# Altium schematic sheet Inverter_540VDC_V2.SchDoc
size A0; SheetNumber: 1; SheetTotal: 1; SPICEModelCacheYQEDCYZF: <root> / <DocumentId>YQEDCYZF</DocumentId> / </root>
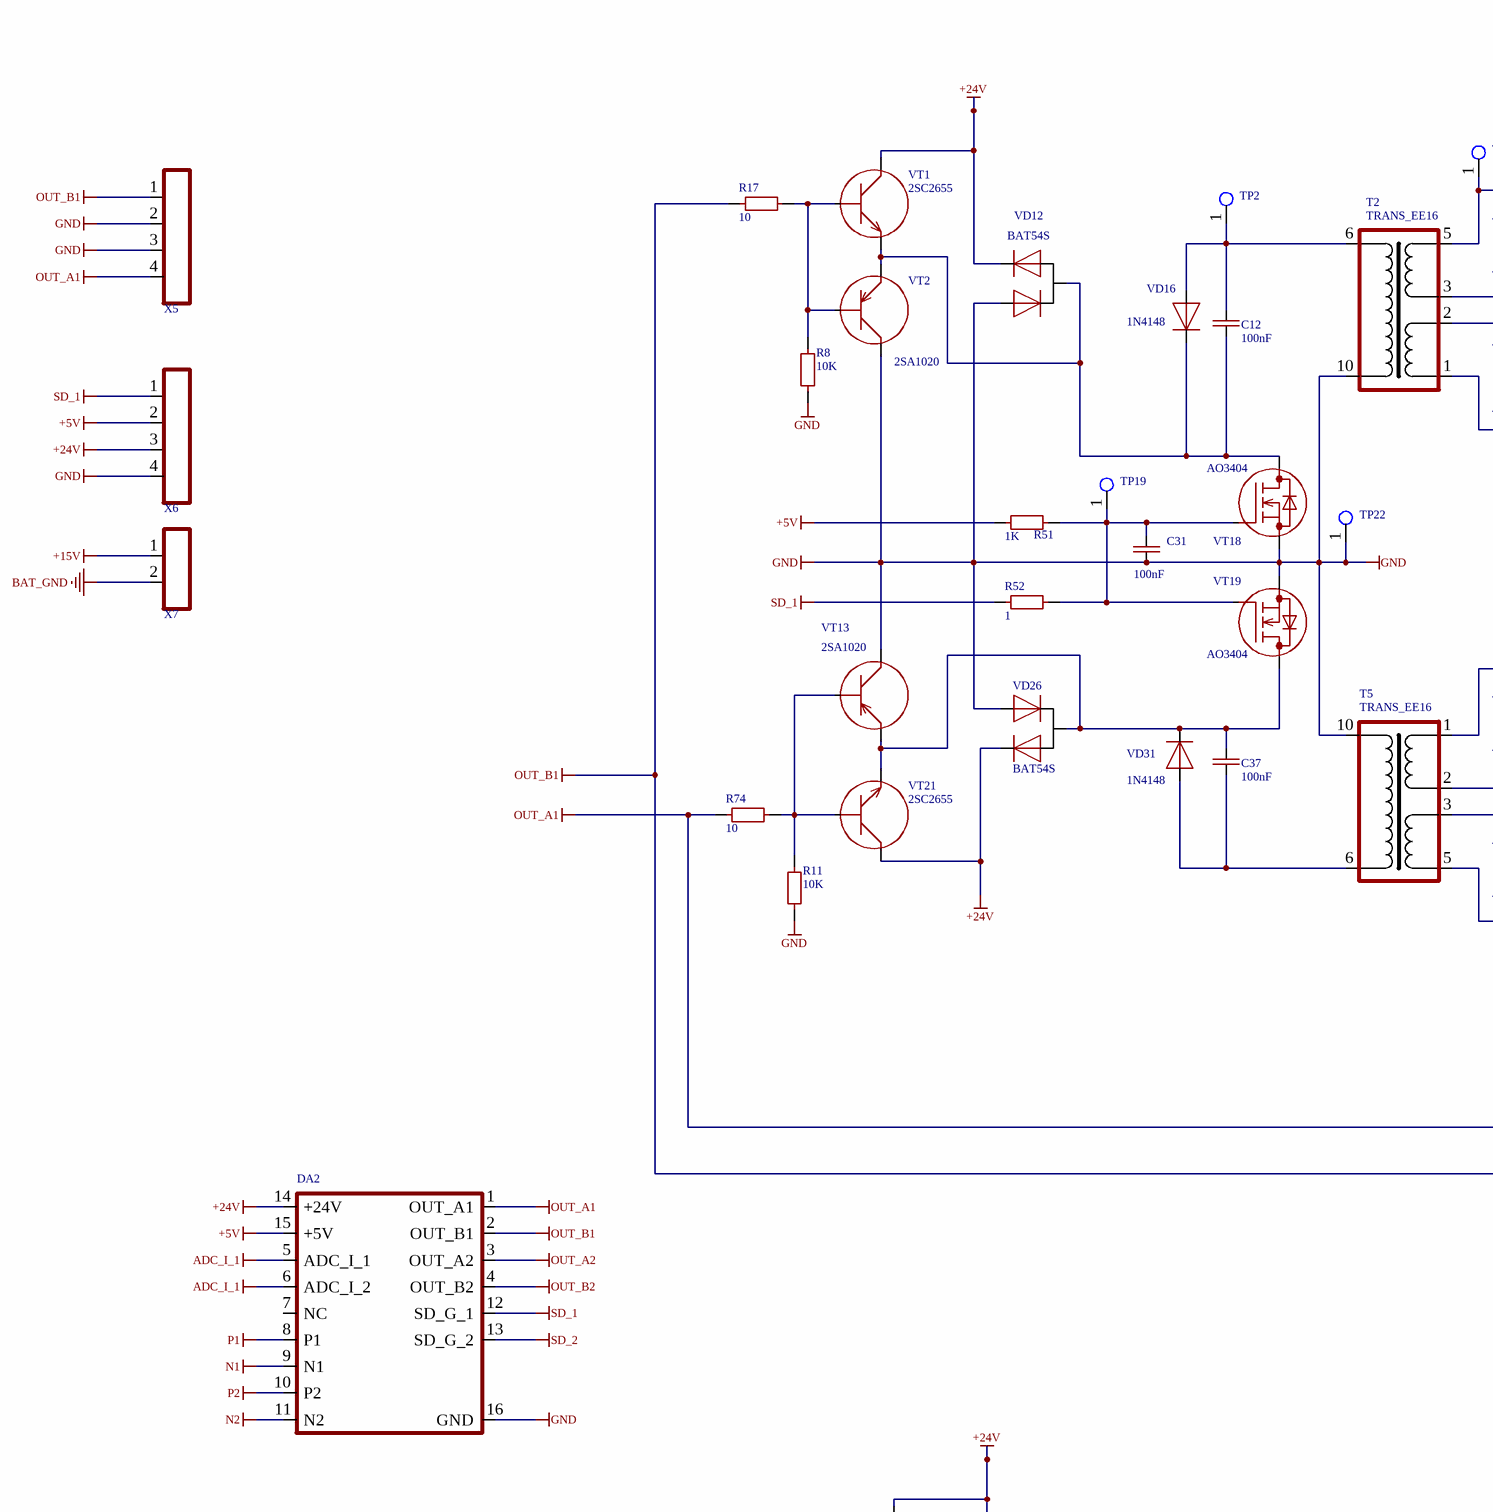
[diagram p0: Inverter_540VDC_V2.SchDoc, top left]
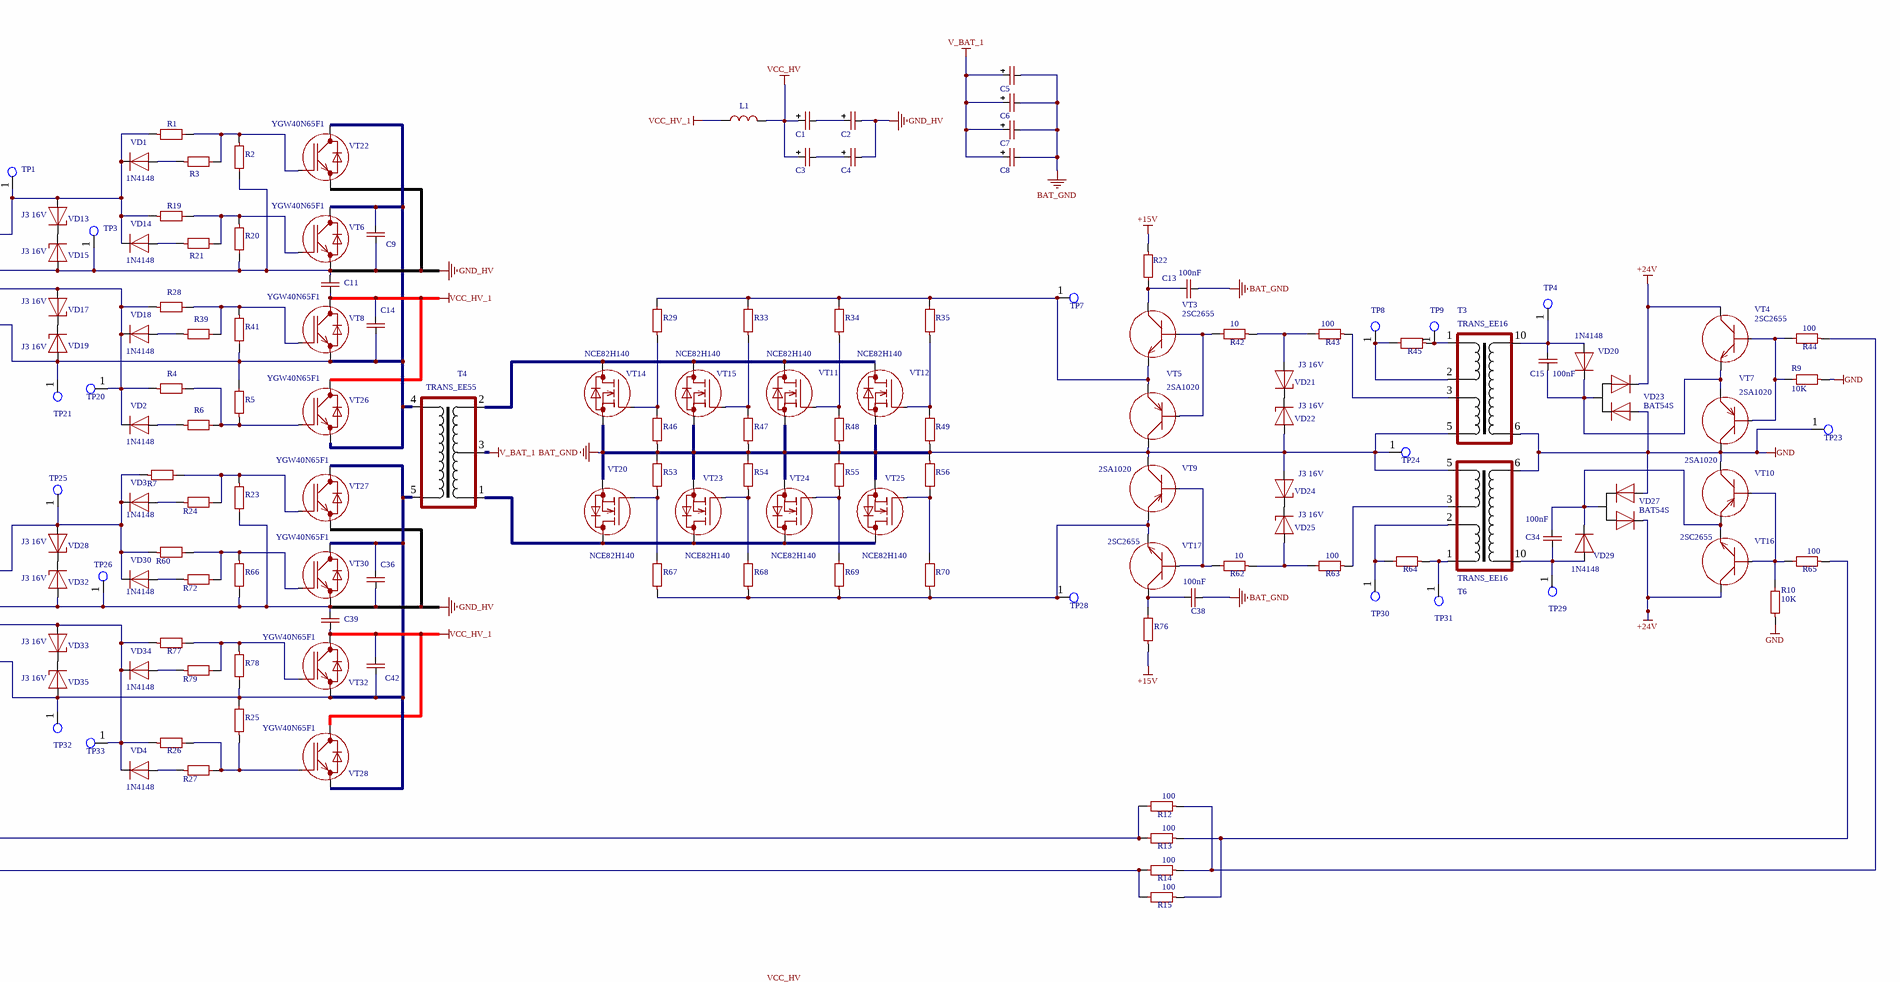
[diagram p1: Inverter_540VDC_V2.SchDoc, top right]
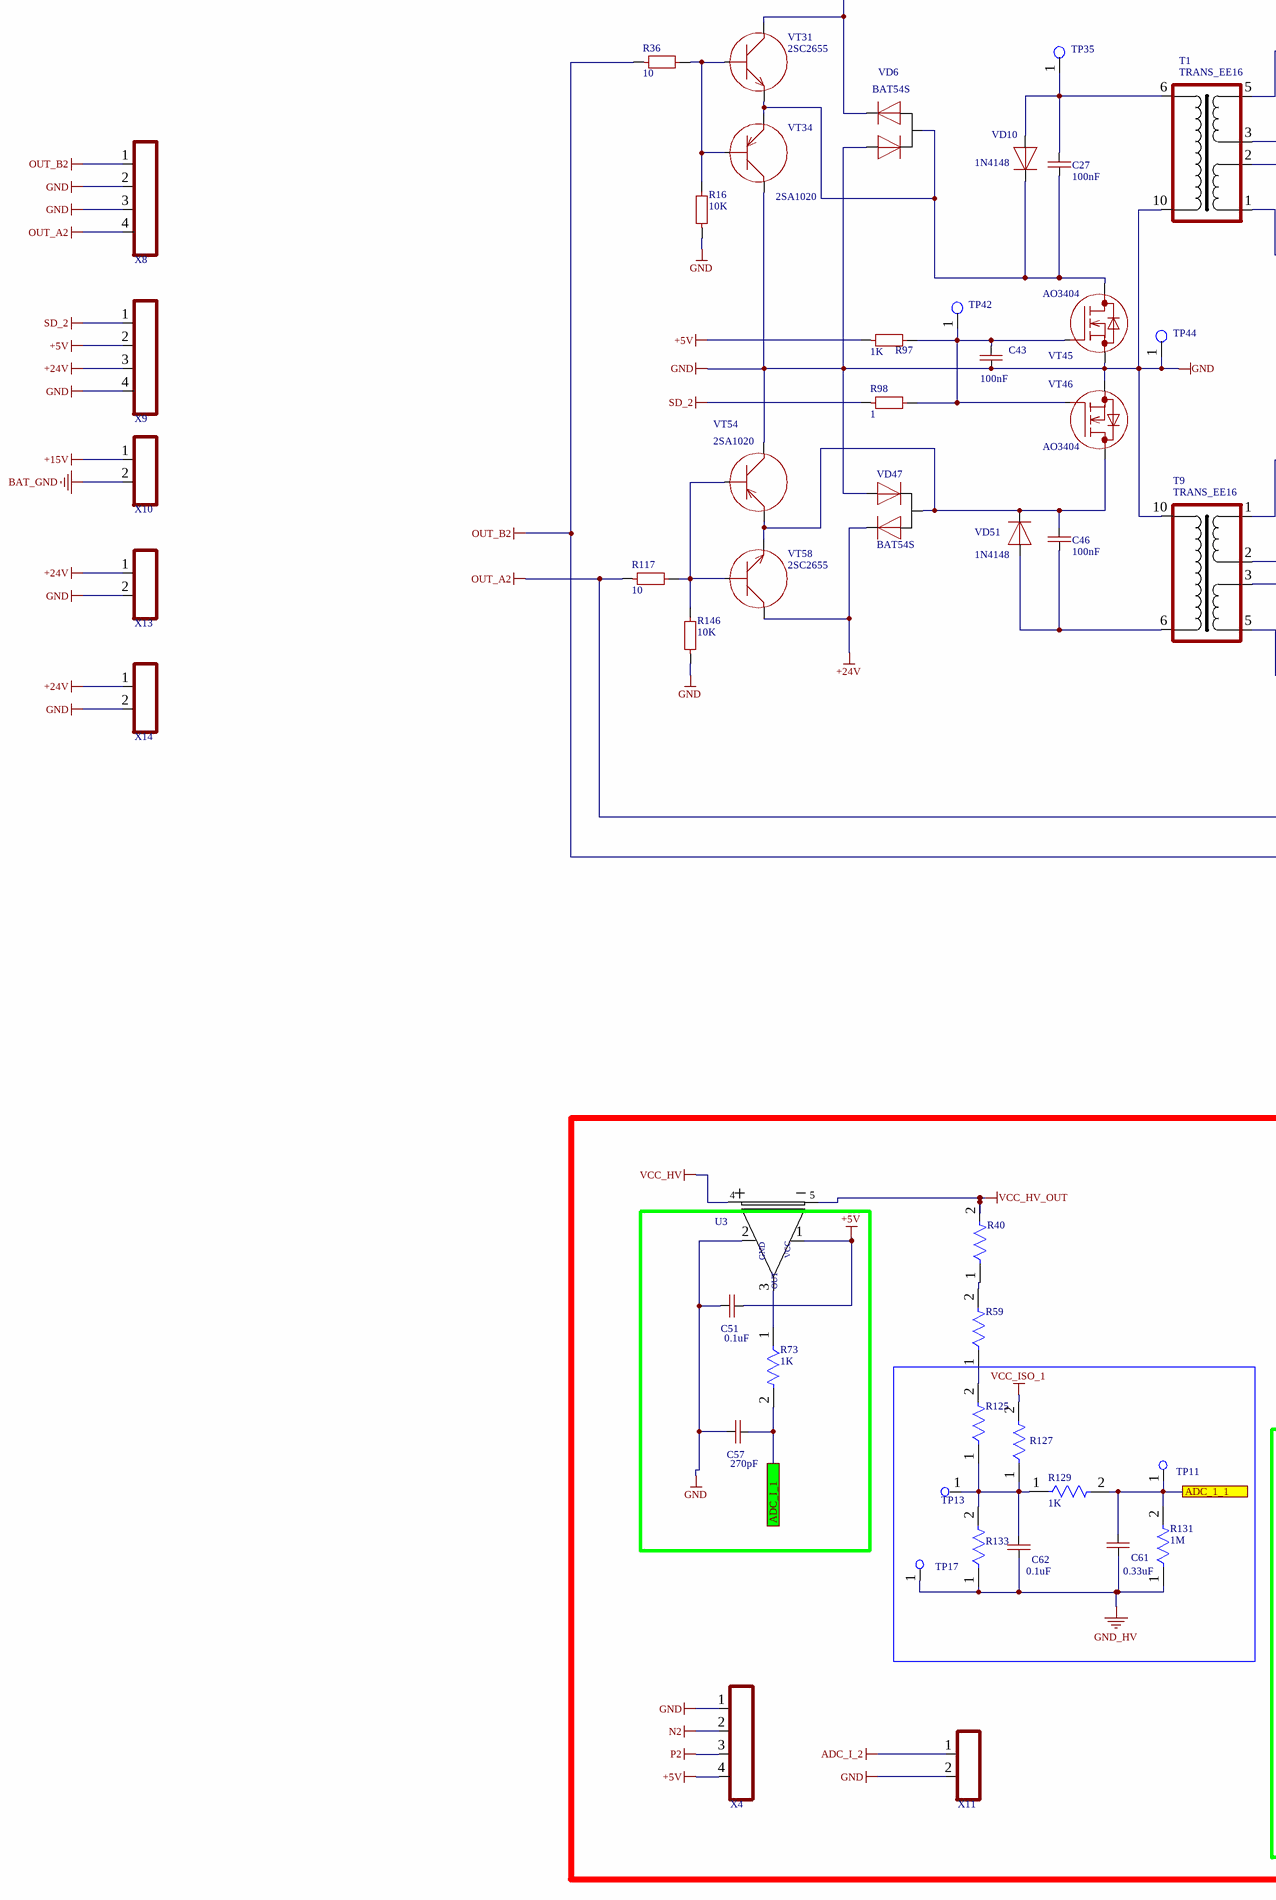
[diagram p2: Inverter_540VDC_V2.SchDoc, bottom left]
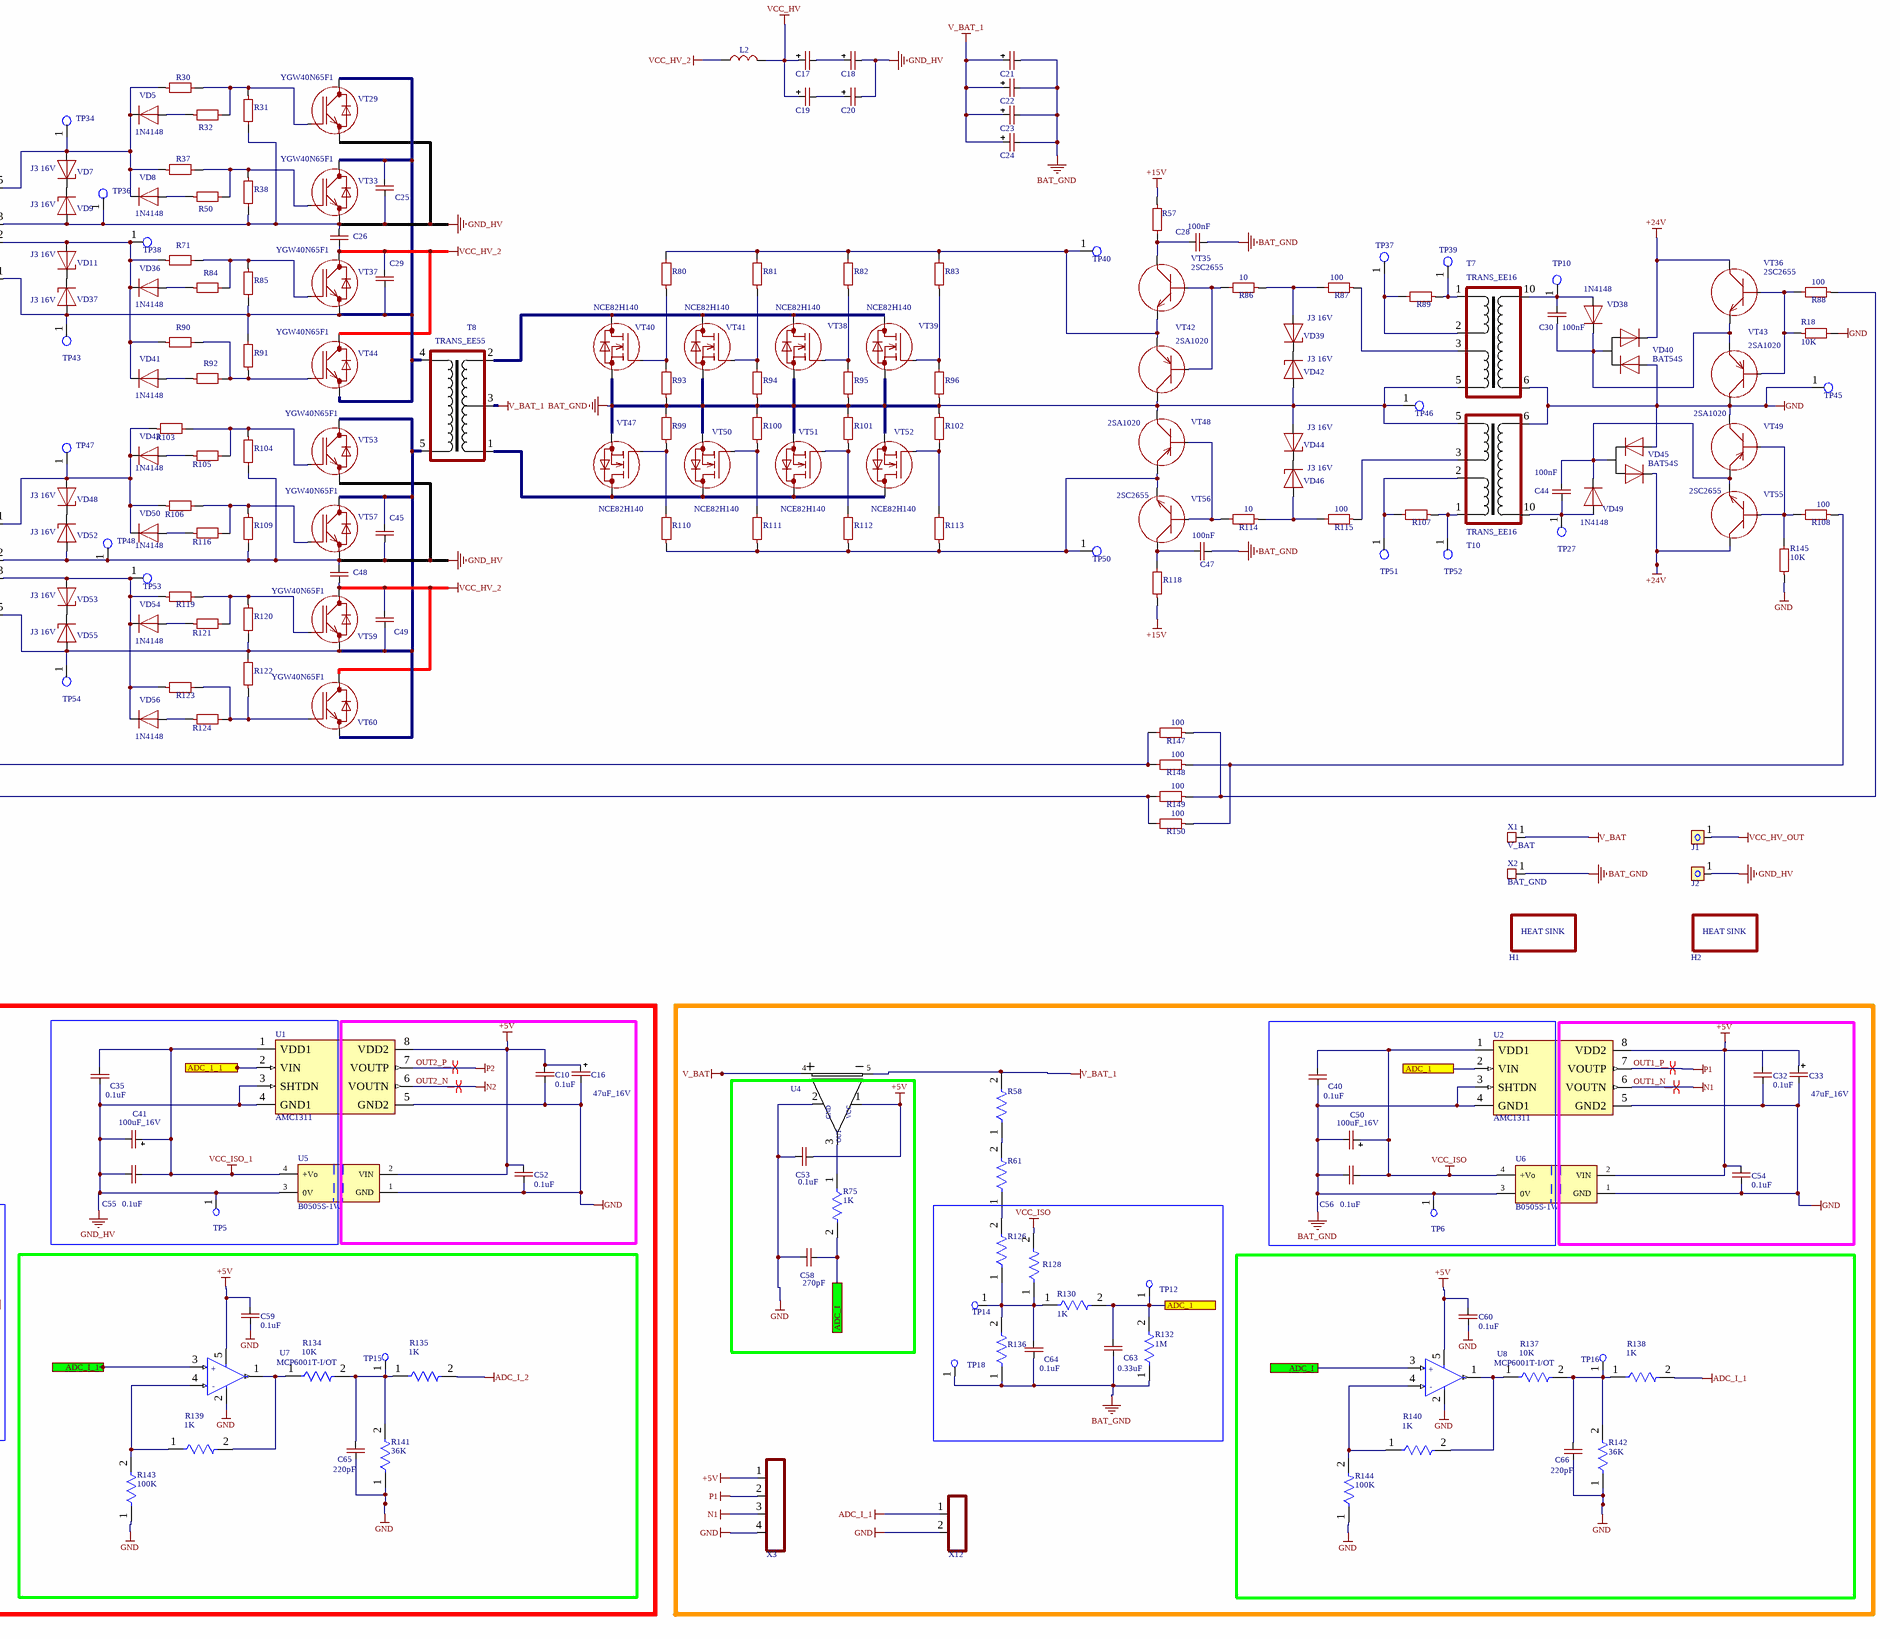
[diagram p3: Inverter_540VDC_V2.SchDoc, bottom right]

## Parts
C1  CAP-POLAR  [CAPPOL-65x35]  (value not drawn)
C2  CAP-POLAR  [CAPPOL-65x35]  (value not drawn)
C3  CAP-POLAR  [CAPPOL-65x35]  (value not drawn)
C4  CAP-POLAR  [CAPPOL-65x35]  (value not drawn)
C5  CAP-POLAR  [CAPPOL-100x35]  (value not drawn)
C6  CAP-POLAR  [CAPPOL-100x35]  (value not drawn)
C7  CAP-POLAR  [CAPPOL-100x35]  (value not drawn)
C8  CAP-POLAR  [CAPPOL-100x35]  (value not drawn)
C9  CAP-NON-POLAR  [CAP-FILM-22.5X26.5X10]  (value not drawn)
C10  0.1uF  [CAP-0805]
C11  CAP-NON-POLAR  [CAP-FILM-22.5X26.5X10]  (value not drawn)
C12  100nF  [CAP-1206]
C13  100nF  [CAP-0805]
C14  CAP-NON-POLAR  [CAP-FILM-22.5X26.5X10]  (value not drawn)
C15  100nF  [CAP-1206]
C16  47uF_16V  [CAP-TAN-D]
C17  CAP-POLAR  [CAPPOL-65x35]  (value not drawn)
C18  CAP-POLAR  [CAPPOL-65x35]  (value not drawn)
C19  CAP-POLAR  [CAPPOL-65x35]  (value not drawn)
C20  CAP-POLAR  [CAPPOL-65x35]  (value not drawn)
C21  CAP-POLAR  [CAPPOL-100x35]  (value not drawn)
C22  CAP-POLAR  [CAPPOL-100x35]  (value not drawn)
C23  CAP-POLAR  [CAPPOL-100x35]  (value not drawn)
C24  CAP-POLAR  [CAPPOL-100x35]  (value not drawn)
C25  CAP-NON-POLAR  [CAP-FILM-22.5X26.5X10]  (value not drawn)
C26  CAP-NON-POLAR  [CAP-FILM-22.5X26.5X10]  (value not drawn)
C27  100nF  [CAP-1206]
C28  100nF  [CAP-0805]
C29  CAP-NON-POLAR  [CAP-FILM-22.5X26.5X10]  (value not drawn)
C30  100nF  [CAP-1206]
C31  100nF  [CAP-1206]
C32  0.1uF  [CAP-0805]
C33  47uF_16V  [CAP-TAN-D]
C34  100nF  [CAP-1206]
C35  0.1uF  [CAP-0805]
C36  CAP-NON-POLAR  [CAP-FILM-22.5X26.5X10]  (value not drawn)
C37  100nF  [CAP-1206]
C38  100nF  [CAP-0805]
C39  CAP-NON-POLAR  [CAP-FILM-22.5X26.5X10]  (value not drawn)
C40  0.1uF  [CAP-0805]
C41  100uF_16V  [CAP-TAN-D]
C42  CAP-NON-POLAR  [CAP-FILM-22.5X26.5X10]  (value not drawn)
C43  100nF  [CAP-1206]
C44  100nF  [CAP-1206]
C45  CAP-NON-POLAR  [CAP-FILM-22.5X26.5X10]  (value not drawn)
C46  100nF  [CAP-1206]
C47  100nF  [CAP-0805]
C48  CAP-NON-POLAR  [CAP-FILM-22.5X26.5X10]  (value not drawn)
C49  CAP-NON-POLAR  [CAP-FILM-22.5X26.5X10]  (value not drawn)
C50  100uF_16V  [CAP-TAN-D]
C51  0.1uF  [CAP-0805]
C52  0.1uF  [CAP-0805]
C53  0.1uF  [CAP-0805]
C54  0.1uF  [CAP-0805]
C55  0.1uF  [CAP-0805]
C56  0.1uF  [CAP-0805]
C57  270pF  [CAP-0805]
C58  270pF  [CAP-0805]
C59  0.1uF  [CAP-0805]
C60  0.1uF  [CAP-0805]
C61  0.33uF  [CAP-0805]
C62  0.1uF  [CAP-0805]
C63  0.33uF  [CAP-0805]
C64  0.1uF  [CAP-1206]
C65  220pF  [CAP-0805]
C66  220pF  [CAP-0805]
DA2  PWM_X2_SG3525  [PWM_X2_SG3525]  (value not drawn)
H1  HEAT SINK  [HEAT SINK]  (value not drawn)
H2  HEAT SINK  [HEAT SINK]  (value not drawn)
J1  MG_136_HT  [Conn_MEIGAN_MG136HT]  (value not drawn)
J2  MG_136_HT  [Conn_MEIGAN_MG136HT]  (value not drawn)
L1  IND-CONST  [DROSSEL_TOR_50X30X20]  (value not drawn)
L2  IND-CONST  [DROSSEL_TOR_50X30X20]  (value not drawn)
R1  RES-CONST  [RES-0805]  (value not drawn)
R2  RES-CONST  [RES-0805]  (value not drawn)
R3  RES-CONST  [RES-0805]  (value not drawn)
R4  RES-CONST  [RES-0805]  (value not drawn)
R5  RES-CONST  [RES-0805]  (value not drawn)
R6  RES-CONST  [RES-0805]  (value not drawn)
R7  RES-CONST  [RES-0805]  (value not drawn)
R8  10K  [RES-0805]
R9  10K  [RES-0805]
R10  10K  [RES-0805]
R11  10K  [RES-0805]
R12  100  [RES-0805]
R13  100  [RES-0805]
R14  100  [RES-0805]
R15  100  [RES-0805]
R16  10K  [RES-0805]
R17  10  [RES-0805]
R18  10K  [RES-0805]
R19  RES-CONST  [RES-0805]  (value not drawn)
R20  RES-CONST  [RES-0805]  (value not drawn)
R21  RES-CONST  [RES-0805]  (value not drawn)
R22  RES-CONST  [RES-2512]  (value not drawn)
R23  RES-CONST  [RES-0805]  (value not drawn)
R24  RES-CONST  [RES-0805]  (value not drawn)
R25  RES-CONST  [RES-0805]  (value not drawn)
R26  RES-CONST  [RES-0805]  (value not drawn)
R27  RES-CONST  [RES-0805]  (value not drawn)
R28  RES-CONST  [RES-0805]  (value not drawn)
R29  RES-CONST  [RES-0805]  (value not drawn)
R30  RES-CONST  [RES-0805]  (value not drawn)
R31  RES-CONST  [RES-0805]  (value not drawn)
R32  RES-CONST  [RES-0805]  (value not drawn)
R33  RES-CONST  [RES-0805]  (value not drawn)
R34  RES-CONST  [RES-0805]  (value not drawn)
R35  RES-CONST  [RES-0805]  (value not drawn)
R36  10  [RES-0805]
R37  RES-CONST  [RES-0805]  (value not drawn)
R38  RES-CONST  [RES-0805]  (value not drawn)
R39  RES-CONST  [RES-0805]  (value not drawn)
R40  (no value)  [RES-1206]
R41  RES-CONST  [RES-0805]  (value not drawn)
R42  10  [RES-0805]
R43  100  [RES-0805]
R44  100  [RES-0805]
R45  RES-CONST  [RES-2512]  (value not drawn)
R46  RES-CONST  [RES-0805]  (value not drawn)
R47  RES-CONST  [RES-0805]  (value not drawn)
R48  RES-CONST  [RES-0805]  (value not drawn)
R49  RES-CONST  [RES-0805]  (value not drawn)
R50  RES-CONST  [RES-0805]  (value not drawn)
R51  1K  [RES-0805]
R52  1  [RES-0805]
R53  RES-CONST  [RES-0805]  (value not drawn)
R54  RES-CONST  [RES-0805]  (value not drawn)
R55  RES-CONST  [RES-0805]  (value not drawn)
R56  RES-CONST  [RES-0805]  (value not drawn)
R57  RES-CONST  [RES-2512]  (value not drawn)
R58  (no value)  [RES-1206]
R59  (no value)  [RES-1206]
R60  RES-CONST  [RES-0805]  (value not drawn)
R61  (no value)  [RES-1206]
R62  10  [RES-0805]
R63  100  [RES-0805]
R64  RES-CONST  [RES-2512]  (value not drawn)
R65  100  [RES-0805]
R66  RES-CONST  [RES-0805]  (value not drawn)
R67  RES-CONST  [RES-0805]  (value not drawn)
R68  RES-CONST  [RES-0805]  (value not drawn)
R69  RES-CONST  [RES-0805]  (value not drawn)
R70  RES-CONST  [RES-0805]  (value not drawn)
R71  RES-CONST  [RES-0805]  (value not drawn)
R72  RES-CONST  [RES-0805]  (value not drawn)
R73  1K  [RES-0805]
R74  10  [RES-0805]
R75  1K  [RES-0805]
R76  RES-CONST  [RES-2512]  (value not drawn)
R77  RES-CONST  [RES-0805]  (value not drawn)
R78  RES-CONST  [RES-0805]  (value not drawn)
R79  RES-CONST  [RES-0805]  (value not drawn)
R80  RES-CONST  [RES-0805]  (value not drawn)
R81  RES-CONST  [RES-0805]  (value not drawn)
R82  RES-CONST  [RES-0805]  (value not drawn)
R83  RES-CONST  [RES-0805]  (value not drawn)
R84  RES-CONST  [RES-0805]  (value not drawn)
R85  RES-CONST  [RES-0805]  (value not drawn)
R86  10  [RES-0805]
R87  100  [RES-0805]
R88  100  [RES-0805]
R89  RES-CONST  [RES-2512]  (value not drawn)
R90  RES-CONST  [RES-0805]  (value not drawn)
R91  RES-CONST  [RES-0805]  (value not drawn)
R92  RES-CONST  [RES-0805]  (value not drawn)
R93  RES-CONST  [RES-0805]  (value not drawn)
R94  RES-CONST  [RES-0805]  (value not drawn)
R95  RES-CONST  [RES-0805]  (value not drawn)
R96  RES-CONST  [RES-0805]  (value not drawn)
R97  1K  [RES-0805]
R98  1  [RES-0805]
R99  RES-CONST  [RES-0805]  (value not drawn)
R100  RES-CONST  [RES-0805]  (value not drawn)
R101  RES-CONST  [RES-0805]  (value not drawn)
R102  RES-CONST  [RES-0805]  (value not drawn)
R103  RES-CONST  [RES-0805]  (value not drawn)
R104  RES-CONST  [RES-0805]  (value not drawn)
R105  RES-CONST  [RES-0805]  (value not drawn)
R106  RES-CONST  [RES-0805]  (value not drawn)
R107  RES-CONST  [RES-2512]  (value not drawn)
R108  100  [RES-0805]
R109  RES-CONST  [RES-0805]  (value not drawn)
R110  RES-CONST  [RES-0805]  (value not drawn)
R111  RES-CONST  [RES-0805]  (value not drawn)
R112  RES-CONST  [RES-0805]  (value not drawn)
R113  RES-CONST  [RES-0805]  (value not drawn)
R114  10  [RES-0805]
R115  100  [RES-0805]
R116  RES-CONST  [RES-0805]  (value not drawn)
R117  10  [RES-0805]
R118  RES-CONST  [RES-2512]  (value not drawn)
R119  RES-CONST  [RES-0805]  (value not drawn)
R120  RES-CONST  [RES-0805]  (value not drawn)
R121  RES-CONST  [RES-0805]  (value not drawn)
R122  RES-CONST  [RES-0805]  (value not drawn)
R123  RES-CONST  [RES-0805]  (value not drawn)
R124  RES-CONST  [RES-0805]  (value not drawn)
R125  (no value)  [RES-1206]
R126  (no value)  [RES-1206]
R127  (no value)  [RES-0805]
R128  (no value)  [RES-0805]
R129  1K  [RES-0805]
R130  1K  [RES-0805]
R131  1M  [RES-0805]
R132  1M  [RES-0805]
R133  RES_1210  [RES_SMD_1210_IPC_B]  (value not drawn)
R134  10K  [RES-0805]
R135  1K  [RES-0805]
R136  RES_1210  [RES_SMD_1210_IPC_B]  (value not drawn)
R137  10K  [RES-0805]
R138  1K  [RES-0805]
R139  1K  [RES-0805]
R140  1K  [RES-0805]
R141  36K  [RES-0805]
R142  36K  [RES-0805]
R143  100K  [RES-0805]
R144  100K  [RES-0805]
R145  10K  [RES-0805]
R146  10K  [RES-0805]
R147  100  [RES-0805]
R148  100  [RES-0805]
R149  100  [RES-0805]
R150  100  [RES-0805]
T1  TRANS_EE16  [TRANS_EE16]
T2  TRANS_EE16  [TRANS_EE16]
T3  TRANS_EE16  [TRANS_EE16]
T4  TRANS_EE55  [TRANS_EE55]
T5  TRANS_EE16  [TRANS_EE16]
T6  TRANS_EE16  [TRANS_EE16]
T7  TRANS_EE16  [TRANS_EE16]
T8  TRANS_EE55  [TRANS_EE55_1]
T9  TRANS_EE16  [TRANS_EE16]
T10  TRANS_EE16  [TRANS_EE16]
TP1  Test_Point_PCB  [Test_Point]  (value not drawn)
TP2  Test_Point_PCB  [Test_Point]  (value not drawn)
TP3  Test_Point_PCB  [Test_Point]  (value not drawn)
TP4  Test_Point_PCB  [Test_Point]  (value not drawn)
TP5  Test_Point_PCB  [Pin_Test_Point(Pink)]  (value not drawn)
TP6  Test_Point_PCB  [Pin_Test_Point(Pink)]  (value not drawn)
TP7  Test_Point_PCB  [Test_Point]  (value not drawn)
TP8  Test_Point_PCB  [Test_Point]  (value not drawn)
TP9  Test_Point_PCB  [Test_Point]  (value not drawn)
TP10  Test_Point_PCB  [Test_Point]  (value not drawn)
TP11  Test_Point_PCB  [Test_Point]  (value not drawn)
TP12  Test_Point_PCB  [Test_Point]  (value not drawn)
TP13  Test_Point_PCB  [Test_Point]  (value not drawn)
TP14  Test_Point_PCB  [Test_Point]  (value not drawn)
TP15  Test_Point_PCB  [Test_Point]  (value not drawn)
TP16  Test_Point_PCB  [Test_Point]  (value not drawn)
TP17  Test_Point_PCB  [Test_Point]  (value not drawn)
TP18  Test_Point_PCB  [Test_Point]  (value not drawn)
TP19  Test_Point_PCB  [Test_Point]  (value not drawn)
TP20  Test_Point_PCB  [Test_Point]  (value not drawn)
TP21  Test_Point_PCB  [Test_Point]  (value not drawn)
TP22  Test_Point_PCB  [Test_Point]  (value not drawn)
TP23  Test_Point_PCB  [Test_Point]  (value not drawn)
TP24  Test_Point_PCB  [Test_Point]  (value not drawn)
TP25  Test_Point_PCB  [Test_Point]  (value not drawn)
TP26  Test_Point_PCB  [Test_Point]  (value not drawn)
TP27  Test_Point_PCB  [Test_Point]  (value not drawn)
TP28  Test_Point_PCB  [Test_Point]  (value not drawn)
TP29  Test_Point_PCB  [Test_Point]  (value not drawn)
TP30  Test_Point_PCB  [Test_Point]  (value not drawn)
TP31  Test_Point_PCB  [Test_Point]  (value not drawn)
TP32  Test_Point_PCB  [Test_Point]  (value not drawn)
TP33  Test_Point_PCB  [Test_Point]  (value not drawn)
TP34  Test_Point_PCB  [Test_Point]  (value not drawn)
TP35  Test_Point_PCB  [Test_Point]  (value not drawn)
TP36  Test_Point_PCB  [Test_Point]  (value not drawn)
TP37  Test_Point_PCB  [Test_Point]  (value not drawn)
TP38  Test_Point_PCB  [Test_Point]  (value not drawn)
TP39  Test_Point_PCB  [Test_Point]  (value not drawn)
TP40  Test_Point_PCB  [Test_Point]  (value not drawn)
TP42  Test_Point_PCB  [Test_Point]  (value not drawn)
TP43  Test_Point_PCB  [Test_Point]  (value not drawn)
TP44  Test_Point_PCB  [Test_Point]  (value not drawn)
TP45  Test_Point_PCB  [Test_Point]  (value not drawn)
TP46  Test_Point_PCB  [Test_Point]  (value not drawn)
TP47  Test_Point_PCB  [Test_Point]  (value not drawn)
TP48  Test_Point_PCB  [Test_Point]  (value not drawn)
TP50  Test_Point_PCB  [Test_Point]  (value not drawn)
TP51  Test_Point_PCB  [Test_Point]  (value not drawn)
TP52  Test_Point_PCB  [Test_Point]  (value not drawn)
TP53  Test_Point_PCB  [Test_Point]  (value not drawn)
TP54  Test_Point_PCB  [Test_Point]  (value not drawn)
U1  AMC1311  [FP-DWV0008A-MFG]
U2  AMC1311  [FP-DWV0008A-MFG]
U3  ACS758  [ACS758-100]  (value not drawn)
U4  ACS758  [ACS758-100]  (value not drawn)
U5  B0505S-1W  [B0505S-1W]
U6  B0505S-1W  [B0505S-1W]
U7  MCP6001T-I/OT  [SOT-23-5]
U8  MCP6001T-I/OT  [SOT-23-5]
VD1  1N4148  [SOD-123]
VD2  1N4148  [SOD-123]
VD3  1N4148  [SOD-123]
VD4  1N4148  [SOD-123]
VD5  1N4148  [SOD-123]
VD6  BAT54S  [SOT23-3]
VD7  J3 16V  [SOD-80]
VD8  1N4148  [SOD-123]
VD9  J3 16V  [SOD-80]
VD10  1N4148  [SOD-123]
VD11  J3 16V  [SOD-80]
VD12  BAT54S  [SOT23-3]
VD13  J3 16V  [SOD-80]
VD14  1N4148  [SOD-123]
VD15  J3 16V  [SOD-80]
VD16  1N4148  [SOD-123]
VD17  J3 16V  [SOD-80]
VD18  1N4148  [SOD-123]
VD19  J3 16V  [SOD-80]
VD20  1N4148  [SOD-123]
VD21  J3 16V  [SOD-80]
VD22  J3 16V  [SOD-80]
VD23  BAT54S  [SOT23-3]
VD24  J3 16V  [SOD-80]
VD25  J3 16V  [SOD-80]
VD26  BAT54S  [SOT23-3]
VD27  BAT54S  [SOT23-3]
VD28  J3 16V  [SOD-80]
VD29  1N4148  [SOD-123]
VD30  1N4148  [SOD-123]
VD31  1N4148  [SOD-123]
VD32  J3 16V  [SOD-80]
VD33  J3 16V  [SOD-80]
VD34  1N4148  [SOD-123]
VD35  J3 16V  [SOD-80]
VD36  1N4148  [SOD-123]
VD37  J3 16V  [SOD-80]
VD38  1N4148  [SOD-123]
VD39  J3 16V  [SOD-80]
VD40  BAT54S  [SOT23-3]
VD41  1N4148  [SOD-123]
VD42  J3 16V  [SOD-80]
VD43  1N4148  [SOD-123]
VD44  J3 16V  [SOD-80]
VD45  BAT54S  [SOT23-3]
VD46  J3 16V  [SOD-80]
VD47  BAT54S  [SOT23-3]
VD48  J3 16V  [SOD-80]
VD49  1N4148  [SOD-123]
VD50  1N4148  [SOD-123]
VD51  1N4148  [SOD-123]
VD52  J3 16V  [SOD-80]
VD53  J3 16V  [SOD-80]
VD54  1N4148  [SOD-123]
VD55  J3 16V  [SOD-80]
VD56  1N4148  [SOD-123]
VT1  2SC2655  [SOT-89]
VT2  2SA1020  [SOT-89]
VT3  2SC2655  [SOT-89]
VT4  2SC2655  [SOT-89]
VT5  2SA1020  [SOT-89]
VT6  YGW40N65F1  [TO-247-3]
VT7  2SA1020  [SOT-89]
VT8  YGW40N65F1  [TO-247-3]
VT9  2SA1020  [SOT-89]
VT10  2SA1020  [SOT-89]
VT11  NCE82H140  [TO-247-3]
VT12  NCE82H140  [TO-247-3]
VT13  2SA1020  [SOT-89]
VT14  NCE82H140  [TO-247-3]
VT15  NCE82H140  [TO-247-3]
VT16  2SC2655  [SOT-89]
VT17  2SC2655  [SOT-89]
VT18  AO3404  [SOT23-3]
VT19  AO3404  [SOT23-3]
VT20  NCE82H140  [TO-247-3]
VT21  2SC2655  [SOT-89]
VT22  YGW40N65F1  [TO-247-3]
VT23  NCE82H140  [TO-247-3]
VT24  NCE82H140  [TO-247-3]
VT25  NCE82H140  [TO-247-3]
VT26  YGW40N65F1  [TO-247-3]
VT27  YGW40N65F1  [TO-247-3]
VT28  YGW40N65F1  [TO-247-3]
VT29  YGW40N65F1  [TO-247-3]
VT30  YGW40N65F1  [TO-247-3]
VT31  2SC2655  [SOT-89]
VT32  YGW40N65F1  [TO-247-3]
VT33  YGW40N65F1  [TO-247-3]
VT34  2SA1020  [SOT-89]
VT35  2SC2655  [SOT-89]
VT36  2SC2655  [SOT-89]
VT37  YGW40N65F1  [TO-247-3]
VT38  NCE82H140  [TO-247-3]
VT39  NCE82H140  [TO-247-3]
VT40  NCE82H140  [TO-247-3]
VT41  NCE82H140  [TO-247-3]
VT42  2SA1020  [SOT-89]
VT43  2SA1020  [SOT-89]
VT44  YGW40N65F1  [TO-247-3]
VT45  AO3404  [SOT23-3]
VT46  AO3404  [SOT23-3]
VT47  NCE82H140  [TO-247-3]
VT48  2SA1020  [SOT-89]
VT49  2SA1020  [SOT-89]
VT50  NCE82H140  [TO-247-3]
VT51  NCE82H140  [TO-247-3]
VT52  NCE82H140  [TO-247-3]
VT53  YGW40N65F1  [TO-247-3]
VT54  2SA1020  [SOT-89]
VT55  2SC2655  [SOT-89]
VT56  2SC2655  [SOT-89]
VT57  YGW40N65F1  [TO-247-3]
VT58  2SC2655  [SOT-89]
VT59  YGW40N65F1  [TO-247-3]
VT60  YGW40N65F1  [TO-247-3]
X1  V_BAT  [Terminal_18x18_M8]
X2  BAT_GND  [Terminal_18x18_M8]
X3  CONN-4-PIN  [CONN-PLS-4-2.54mm_1]  (value not drawn)
X4  CONN-4-PIN  [CONN-PLS-4-2.54mm_1]  (value not drawn)
X5  CONN-4-PIN  [CONN-PLS-4-2.54mm_1]  (value not drawn)
X6  CONN-4-PIN  [CONN-PLS-4-2.54mm_1]  (value not drawn)
X7  CONN-2-PIN  [XH2-]  (value not drawn)
X8  CONN-4-PIN  [CONN-PLS-4-2.54mm_1]  (value not drawn)
X9  CONN-4-PIN  [CONN-PLS-4-2.54mm_1]  (value not drawn)
X10  CONN-2-PIN  [XH2-]  (value not drawn)
X11  CONN-2-PIN  [XH2-]  (value not drawn)
X12  CONN-2-PIN  [XH2-]  (value not drawn)
X13  CONN-2-PIN  [XH2-]  (value not drawn)
X14  CONN-2-PIN  [XH2-]  (value not drawn)

## Ports
ADC_1, ADC_1_1, ADC_I, ADC_I_1

## Nets
+5V: C10.1 C16.1(+) C32.1 C33.1(+) C51.2 C52.1 C53.2 C54.1 C59.2 C60.2 DA2.15(+5V) R51.1 R97.1 U1.8(VDD2) U2.8(VDD2) U3.1(+VCC) U4.1(+VCC) U5.2(VIN) U6.2(VIN) U7.5(VDD) U8.5(VDD) X3.1 X4.4 X6.2 X9.2
+15V: R22.1 R57.1 R76.1 R118.1 X7.1 X10.1
+24V: DA2.14(+24V) VD6.2(C) VD12.2(C) VD23.2(C) VD26.2(C) VD27.2(C) VD40.2(C) VD45.2(C) VD47.2(C) VT1.2(C) VT4.2(C) VT16.2(C) VT21.2(C) VT31.2(C) VT36.2(C) VT55.2(C) VT58.2(C) X6.3 X9.3 X13.1 X14.1
ADC_I_1: DA2.5(ADC_I_1) DA2.6(ADC_I_2) R138.2 X12.1
ADC_I_2: R135.2 X11.1
BAT_GND: C5.2(-) C6.2(-) C7.2(-) C8.2(-) C13.1 C21.2(-) C22.2(-) C23.2(-) C24.2(-) C28.1 C38.1 C40.1 C47.1 C50.2(-) C56.2 C63.1 C64.1 R46.1 R47.1 R48.1 R49.1 R53.2 R54.2 R55.2 R56.1 R93.1 R94.1 R95.1 R96.1 R99.2 R100.2 R101.2 R102.1 R132.1 R136.1 T3.5 T6.5 T7.5 T10.5 TP6.1(G9) TP18.1(G9) TP24.1(G9) TP46.1(G9) U2.3(SHTDN) U2.4(GND1) U6.3(0V) VD22.2(A) VD24.2(A) VD42.2(A) VD44.2(A) VT5.2(C) VT9.2(C) VT11.3(S) VT12.3(S) VT14.3(S) VT15.3(S) VT20.3(S) VT23.3(S) VT24.3(S) VT25.3(S) VT38.3(S) VT39.3(S) VT40.3(S) VT41.3(S) VT42.2(C) VT47.3(S) VT48.2(C) VT50.3(S) VT51.3(S) VT52.3(S) X2.1 X7.2 X10.2
GND: C10.2 C16.2(-) C31.1 C32.2 C33.2(-) C43.1 C51.1 C52.2 C53.1 C54.2 C57.1 C58.1 C59.1 C60.1 C65.1 C66.1 DA2.16(GND) R8.1 R9.1 R10.1 R11.1 R16.1 R18.2 R141.1 R142.1 R143.1 R144.1 R145.1 R146.1 T1.10 T2.10 T3.6 T5.10 T6.6 T7.6 T9.10 T10.6 TP22.1(G9) TP23.1(G9) TP44.1(G9) TP45.1(G9) U1.5(GND2) U2.5(GND2) U3.2(GND) U4.2(GND) U5.1(GND) U6.1(GND) U7.2(VSS) U8.2(VSS) VD6.1(A) VD12.1(A) VD23.1(A) VD26.1(A) VD27.1(A) VD40.1(A) VD45.1(A) VD47.1(A) VT2.2(C) VT7.2(C) VT10.2(C) VT13.2(C) VT18.2(S) VT19.2(S) VT34.2(C) VT43.2(C) VT45.2(S) VT46.2(S) VT49.2(C) VT54.2(C) X3.4 X4.1 X5.2 X5.3 X6.4 X8.2 X8.3 X9.4 X11.2 X12.2 X13.2 X14.2
GND_HV: C2.2(-) C4.2(-) C9.1 C11.2 C18.2(-) C20.2(-) C25.1 C26.2 C35.1 C36.1 C39.2 C41.2(-) C45.1 C48.2 C55.2 C61.1 C62.1 J2.1 R2.2 R20.2 R23.2 R31.2 R38.2 R66.2 R104.2 R109.2 R131.1 R133.1 T1.3 T2.3 T5.2 T9.2 TP3.1(G9) TP5.1(G9) TP17.1(G9) TP26.1(G9) TP36.1(G9) TP48.1(G9) U1.3(SHTDN) U1.4(GND1) U5.3(0V) VD9.2(A) VD15.2(A) VD32.2(A) VD52.2(A) VT6.3(E) VT22.3(E) VT27.3(E) VT29.3(E) VT30.3(E) VT33.3(E) VT53.3(E) VT57.3(E)
OUT1_N: DA2.9(N1) U2.6(VOUTN) X3.3  [also labelled N1]
OUT1_P: DA2.8(P1) U2.7(VOUTP) X3.2  [also labelled P1]
OUT2_N: DA2.11(N2) U1.6(VOUTN) X4.2  [also labelled N2]
OUT2_P: DA2.10(P2) U1.7(VOUTP) X4.3  [also labelled P2]
OUT_A1: DA2.1(OUT_A1) R12.2 R13.2 R74.1 X5.4
OUT_A2: DA2.3(OUT_A2) R117.1 R147.2 R148.2 X8.4
OUT_B1: DA2.2(OUT_B1) R14.2 R15.2 R17.1 X5.1
OUT_B2: DA2.4(OUT_B2) R36.1 R149.2 R150.2 X8.1
SD_1: DA2.12(SD_G_1) R52.1 X6.1
SD_2: DA2.13(SD_G_2) R98.1 X9.1
V_BAT: U4.4(+IP) X1.1
V_BAT_1: C5.1(+) C6.1(+) C7.1(+) C8.1(+) C21.1(+) C22.1(+) C23.1(+) C24.1(+) R58.2 T4.3 T8.3 U4.5(-IP)
VCC_HV: C1.1(+) C3.1(+) C17.1(+) C19.1(+) L1.2 L2.2 U3.4(+IP)
VCC_HV_1: C11.1 C14.2 C39.1 C42.2 L1.1 VT8.2(C) VT26.2(C) VT28.2(C) VT32.2(C)
VCC_HV_2: C26.1 C29.2 C48.1 C49.2 L2.1 VT37.2(C) VT44.2(C) VT59.2(C) VT60.2(C)
VCC_HV_OUT: J1.1 R40.2 U3.5(-IP)
VCC_ISO: C40.2 C50.1(+) C56.1 R128.2 U2.1(VDD1) U6.4(+Vo)
VCC_ISO_1: C35.2 C41.1(+) C55.1 R127.2 U1.1(VDD1) U5.4(+Vo)
ADC_1: C63.2 R130.2 R132.2 TP12.1(G9) U2.2(VIN) ; port ADC_1
ADC_1_1: C61.2 R129.2 R131.2 TP11.1(G9) U1.2(VIN) ; port ADC_1_1
ADC_I: C58.2 R75.2 U8.3(VIN+) ; port ADC_I
ADC_I_1: C57.2 R73.2 U7.3(VIN+) ; port ADC_I_1  [a separate net that carries the same name]
NetC1_2: C1.2(-) C2.1(+)
NetC3_2: C3.2(-) C4.1(+)
NetC9_2: C9.2 C14.1 R5.2 R41.2 T2.1 T4.4 TP21.1(G9) VD19.2(A) VT6.2(C) VT8.3(E) VT22.2(C) VT26.3(E)
NetC12_1: C12.1 VD12.3(x) VD16.1(C) VT1.3(E) VT2.3(E) VT18.3(D)
NetC12_2: C12.2 T2.6 TP2.1(G9) VD16.2(A)
NetC13_2: C13.2 R22.2 VT3.2(C)
NetC15_1: C15.1 T3.10 TP4.1(G9) VD20.2(A)
NetC15_2: C15.2 VD20.1(C) VD23.3(x) VT4.3(E) VT7.3(E)
NetC17_2: C17.2(-) C18.1(+)
NetC19_2: C19.2(-) C20.1(+)
NetC25_2: C25.2 C29.1 R85.2 R91.2 T1.1 T8.4 TP43.1(G9) VD37.2(A) VT29.2(C) VT33.2(C) VT37.3(E) VT44.3(E)
NetC27_1: C27.1 VD6.3(x) VD10.1(C) VT31.3(E) VT34.3(E) VT45.3(D)
NetC27_2: C27.2 T1.6 TP35.1(G9) VD10.2(A)
NetC28_2: C28.2 R57.2 VT35.2(C)
NetC30_1: C30.1 T7.10 TP10.1(G9) VD38.2(A)
NetC30_2: C30.2 VD38.1(C) VD40.3(x) VT36.3(E) VT43.3(E)
NetC31_2: C31.2 R51.2 R52.2 TP19.1(G9) VT18.1(G) VT19.1(G)
NetC34_1: C34.1 VD27.3(x) VD29.1(C) VT10.3(E) VT16.3(E)
NetC34_2: C34.2 T6.10 TP29.1(G9) VD29.2(A)
NetC36_2: C36.2 C42.1 R25.2 R78.2 T4.5 T5.5 TP32.1(G9) VD35.2(A) VT27.2(C) VT28.3(E) VT30.2(C) VT32.3(E)
NetC37_1: C37.1 T5.6 VD31.2(A)
NetC37_2: C37.2 VD26.3(x) VD31.1(C) VT13.3(E) VT19.3(D) VT21.3(E)
NetC38_2: C38.2 R76.2 VT17.2(C)
NetC43_2: C43.2 R97.2 R98.2 TP42.1(G9) VT45.1(G) VT46.1(G)
NetC44_1: C44.1 VD45.3(x) VD49.1(C) VT49.3(E) VT55.3(E)
NetC44_2: C44.2 T10.10 TP27.1(G9) VD49.2(A)
NetC45_2: C45.2 C49.1 R120.2 R122.2 T8.5 T9.5 TP54.1(G9) VD55.2(A) VT53.2(C) VT57.2(C) VT59.3(E) VT60.3(E)
NetC46_1: C46.1 T9.6 VD51.2(A)
NetC46_2: C46.2 VD47.3(x) VD51.1(C) VT46.3(D) VT54.3(E) VT58.3(E)
NetC47_2: C47.2 R118.2 VT56.2(C)
NetC62_2: C62.2 R125.1 R127.1 R129.1 R133.2 TP13.1(G9)
NetC64_2: C64.2 R126.1 R128.1 R130.1 R136.2 TP14.1(G9)
NetC65_2: C65.2 R134.2 R135.1 R141.2 TP15.1(G9)
NetC66_2: C66.2 R137.2 R138.1 R142.2 TP16.1(G9)
NetR1_1: R1.1 R19.1 T2.5 TP1.1(G9) VD1.1(C) VD13.2(A) VD14.1(C)
NetR1_2: R1.2 R2.1 R3.2 VT22.1(G)
NetR3_1: R3.1 VD1.2(A)
NetR4_1: R4.1 R28.1 T2.2 TP20.1(G9) VD2.1(C) VD17.2(A) VD18.1(C)
NetR4_2: R4.2 R5.1 R6.2 VT26.1(G)
NetR6_1: R6.1 VD2.2(A)
NetR7_1: R7.1 R60.1 T5.1 TP25.1(G9) VD3.1(C) VD28.2(A) VD30.1(C)
NetR7_2: R7.2 R23.1 R24.2 VT27.1(G)
NetR8_2: R8.2 R17.2 VT1.1(B) VT2.1(B)
NetR9_2: R9.2 R44.2 VT4.1(B) VT7.1(B)
NetR10_2: R10.2 R65.2 VT10.1(B) VT16.1(B)
NetR11_2: R11.2 R74.2 VT13.1(B) VT21.1(B)
NetR12_1: R12.1 R14.1 R44.1
NetR13_1: R13.1 R15.1 R65.1
NetR16_2: R16.2 R36.2 VT31.1(B) VT34.1(B)
NetR18_1: R18.1 R88.2 VT36.1(B) VT43.1(B)
NetR19_2: R19.2 R20.1 R21.2 VT6.1(G)
NetR21_1: R21.1 VD14.2(A)
NetR24_1: R24.1 VD3.2(A)
NetR25_1: R25.1 R26.2 R27.2 VT28.1(G)
NetR26_1: R26.1 R77.1 T5.3 TP33.1(G9) VD4.1(C) VD33.2(A) VD34.1(C)
NetR27_1: R27.1 VD4.2(A)
NetR28_2: R28.2 R39.2 R41.1 VT8.1(G)
NetR29_1: R29.1 R46.2 VT14.1(G)
NetR29_2: R29.2 R33.2 R34.2 R35.2 TP7.1(G9) VT3.3(E) VT5.3(E)
NetR30_1: R30.1 R37.1 T1.5 TP34.1(G9) VD5.1(C) VD7.2(A) VD8.1(C)
NetR30_2: R30.2 R31.1 R32.2 VT29.1(G)
NetR32_1: R32.1 VD5.2(A)
NetR33_1: R33.1 R47.2 VT15.1(G)
NetR34_1: R34.1 R48.2 VT11.1(G)
NetR35_1: R35.1 R49.2 VT12.1(G)
NetR37_2: R37.2 R38.1 R50.2 VT33.1(G)
NetR39_1: R39.1 VD18.2(A)
NetR40_1: R40.1 R59.2
NetR42_1: R42.1 R43.2 VD21.2(A)
NetR42_2: R42.2 VT3.1(B) VT5.1(B)
NetR43_1: R43.1 T3.3
NetR45_1: R45.1 T3.1 TP9.1(G9)
NetR45_2: R45.2 T3.2 TP8.1(G9)
NetR50_1: R50.1 VD8.2(A)
NetR53_1: R53.1 R67.2 VT20.1(G)
NetR54_1: R54.1 R68.2 VT23.1(G)
NetR55_1: R55.1 R69.2 VT24.1(G)
NetR56_2: R56.2 R70.2 VT25.1(G)
NetR58_1: R58.1 R61.2
NetR59_1: R59.1 R125.2
NetR60_2: R60.2 R66.1 R72.2 VT30.1(G)
NetR61_1: R61.1 R126.2
NetR62_1: R62.1 R63.2 VD25.2(A)
NetR62_2: R62.2 VT9.1(B) VT17.1(B)
NetR63_1: R63.1 T6.3
NetR64_1: R64.1 T6.1 TP31.1(G9)
NetR64_2: R64.2 T6.2 TP30.1(G9)
NetR67_1: R67.1 R68.1 R69.1 R70.1 TP28.1(G9) VT9.3(E) VT17.3(E)
NetR71_1: R71.1 R90.1 T1.2 TP38.1(G9) VD11.2(A) VD36.1(C) VD41.1(C)
NetR71_2: R71.2 R84.2 R85.1 VT37.1(G)
NetR72_1: R72.1 VD30.2(A)
NetR73_1: R73.1 U3.3(OUT)
NetR75_1: R75.1 U4.3(OUT)
NetR77_2: R77.2 R78.1 R79.2 VT32.1(G)
NetR79_1: R79.1 VD34.2(A)
NetR80_1: R80.1 R93.2 VT40.1(G)
NetR80_2: R80.2 R81.2 R82.2 R83.2 TP40.1(G9) VT35.3(E) VT42.3(E)
NetR81_1: R81.1 R94.2 VT41.1(G)
NetR82_1: R82.1 R95.2 VT38.1(G)
NetR83_1: R83.1 R96.2 VT39.1(G)
NetR84_1: R84.1 VD36.2(A)
NetR86_1: R86.1 R87.2 VD39.2(A)
NetR86_2: R86.2 VT35.1(B) VT42.1(B)
NetR87_1: R87.1 T7.3
NetR88_1: R88.1 R147.1 R149.1
NetR89_1: R89.1 T7.1 TP39.1(G9)
NetR89_2: R89.2 T7.2 TP37.1(G9)
NetR90_2: R90.2 R91.1 R92.2 VT44.1(G)
NetR92_1: R92.1 VD41.2(A)
NetR99_1: R99.1 R110.2 VT47.1(G)
NetR100_1: R100.1 R111.2 VT50.1(G)
NetR101_1: R101.1 R112.2 VT51.1(G)
NetR102_2: R102.2 R113.2 VT52.1(G)
NetR103_1: R103.1 R106.1 T9.1 TP47.1(G9) VD43.1(C) VD48.2(A) VD50.1(C)
NetR103_2: R103.2 R104.1 R105.2 VT53.1(G)
NetR105_1: R105.1 VD43.2(A)
NetR106_2: R106.2 R109.1 R116.2 VT57.1(G)
NetR107_1: R107.1 T10.1 TP52.1(G9)
NetR107_2: R107.2 T10.2 TP51.1(G9)
NetR108_1: R108.1 R148.1 R150.1
NetR108_2: R108.2 R145.2 VT49.1(B) VT55.1(B)
NetR110_1: R110.1 R111.1 R112.1 R113.1 TP50.1(G9) VT48.3(E) VT56.3(E)
NetR114_1: R114.1 R115.2 VD46.2(A)
NetR114_2: R114.2 VT48.1(B) VT56.1(B)
NetR115_1: R115.1 T10.3
NetR116_1: R116.1 VD50.2(A)
NetR117_2: R117.2 R146.2 VT54.1(B) VT58.1(B)
NetR119_1: R119.1 R123.1 T9.3 TP53.1(G9) VD53.2(A) VD54.1(C) VD56.1(C)
NetR119_2: R119.2 R120.1 R121.2 VT59.1(G)
NetR121_1: R121.1 VD54.2(A)
NetR122_1: R122.1 R123.2 R124.2 VT60.1(G)
NetR124_1: R124.1 VD56.2(A)
NetR134_1: R134.1 R139.2 U7.1(VOUT)
NetR137_1: R137.1 R140.2 U8.1(VOUT)
NetR139_1: R139.1 R143.2 U7.4(VIN-)
NetR140_1: R140.1 R144.2 U8.4(VIN-)
NetT4_1: T4.1 VT20.2(D) VT23.2(D) VT24.2(D) VT25.2(D)
NetT4_2: T4.2 VT11.2(D) VT12.2(D) VT14.2(D) VT15.2(D)
NetT8_1: T8.1 VT47.2(D) VT50.2(D) VT51.2(D) VT52.2(D)
NetT8_2: T8.2 VT38.2(D) VT39.2(D) VT40.2(D) VT41.2(D)
NetVD7_1: VD7.1(C) VD9.1(C)
NetVD11_1: VD11.1(C) VD37.1(C)
NetVD13_1: VD13.1(C) VD15.1(C)
NetVD17_1: VD17.1(C) VD19.1(C)
NetVD21_1: VD21.1(C) VD22.1(C)
NetVD24_1: VD24.1(C) VD25.1(C)
NetVD28_1: VD28.1(C) VD32.1(C)
NetVD33_1: VD33.1(C) VD35.1(C)
NetVD39_1: VD39.1(C) VD42.1(C)
NetVD44_1: VD44.1(C) VD46.1(C)
NetVD48_1: VD48.1(C) VD52.1(C)
NetVD53_1: VD53.1(C) VD55.1(C)

Not connected (* = marked no-connect by the designer): DA2 7(NC)

## Layout directives
differential pair: (no net found under the mark), OUT1_N, OUT2_N

## Notes on the sheet
- (in symbol ACS758) VCC
- (in symbol MCP6001T) +; -

## Library data of the parts
C10 C12 C13 C15 C27 C28 C30-C32 C34 C35 C37 C38 C40 C43 C44 C46 C47 C51-C66 = CAP-NON-POLAR
C16 C33 = CAP-POLAR
C41 C50 = CAP_POL_SMD
J1 J2 = Connector_MEIGAN_MG136HT
R8-R18 R36 R40 R42-R44 R51 R52 R58 R59 R61-R63 R65 R73-R75 R86-R88 R97 R98 R108 R114 R115 R117 R125-R132 R134 R137 R141-R150 = RES-CONST
R135 R138-R140 = RES-CONST: 10K
TP1-TP40 TP42-TP48 TP50-TP54 = TP_PCB?: Test_Point
U7 U8 = MCP6001T: IC OPAMP GP 1 CIRCUIT SOT23-5; Number of Amplifiers: 1; Voltage: 6V; Power Supply Rejection Ratio (PSRR): 86dB; Common Mode Rejection Ratio: 60dB; Unity Gain Bandwidth Product: 1MHz; Slew Rate: 0.6V/µs; Output Current per Channel: 23mA; Nominal Supply Current: 100uA; Input Offset Voltage (Vos): 4.5mV; Input Bias Current: 1pA; Operating Supply Voltage: 5.5V; Min Supply Voltage: 1.8V; Voltage Gain: 112dB; Length: 3.1mm; REACH SVHC: No SVHC; Number of Pins: 5; Package Quantity: 1; Radiation Hardening: No; Mount: Surface Mount; Number of Circuits: 1; Number of Elements: 1; Output Current: 23mA; Packaging: Tape and Reel; Height: 1.3mm; Lead Free: Lead Free; Min Operating Temperature: -40°C; Bandwidth: 1MHz; Contact Plating: Tin; Max Supply Voltage: 6V; Max Operating Temperature: 85°C; Width: 1.8mm; Case/Package: SOT-23; Operating Supply Current: 100uA; Number of Channels: 1; Gain Bandwidth Product: 1MHz
VD1-VD5 VD8 VD10 VD14 VD16 VD18 VD20 VD29-VD31 VD34 VD36 VD38 VD41 VD43 VD49-VD51 VD54 VD56 = DIODE
VD6 VD12 VD23 VD26 VD27 VD40 VD45 VD47 = DIODE-4
VD7 VD9 VD11 VD13 VD15 VD17 VD19 VD21 VD22 VD24 VD25 VD28 VD32 VD33 VD35 VD37 VD39 VD42 VD44 VD46 VD48 VD52 VD53 VD55 = ZENER
VT1 VT3 VT4 VT16 VT17 VT21 VT31 VT35 VT36 VT55 VT56 VT58 = BIPOLAR-NPN-BEC
VT2 VT5 VT7 VT9 VT10 VT13 VT34 VT42 VT43 VT48 VT49 VT54 = BIPOLAR-PNP-BCE
VT6 VT8 VT22 VT26-VT30 VT32 VT33 VT37 VT44 VT53 VT57 VT59 VT60 = IGBT-N-GCE
VT11 VT12 VT14 VT15 VT18-VT20 VT23-VT25 VT38-VT41 VT45-VT47 VT50-VT52 = MOSFET-N-GDS
X1 X2 = Terminal_18x18_M8